# EAGLE design EiBotBoard-v27 (EAGLE 9.6.2)
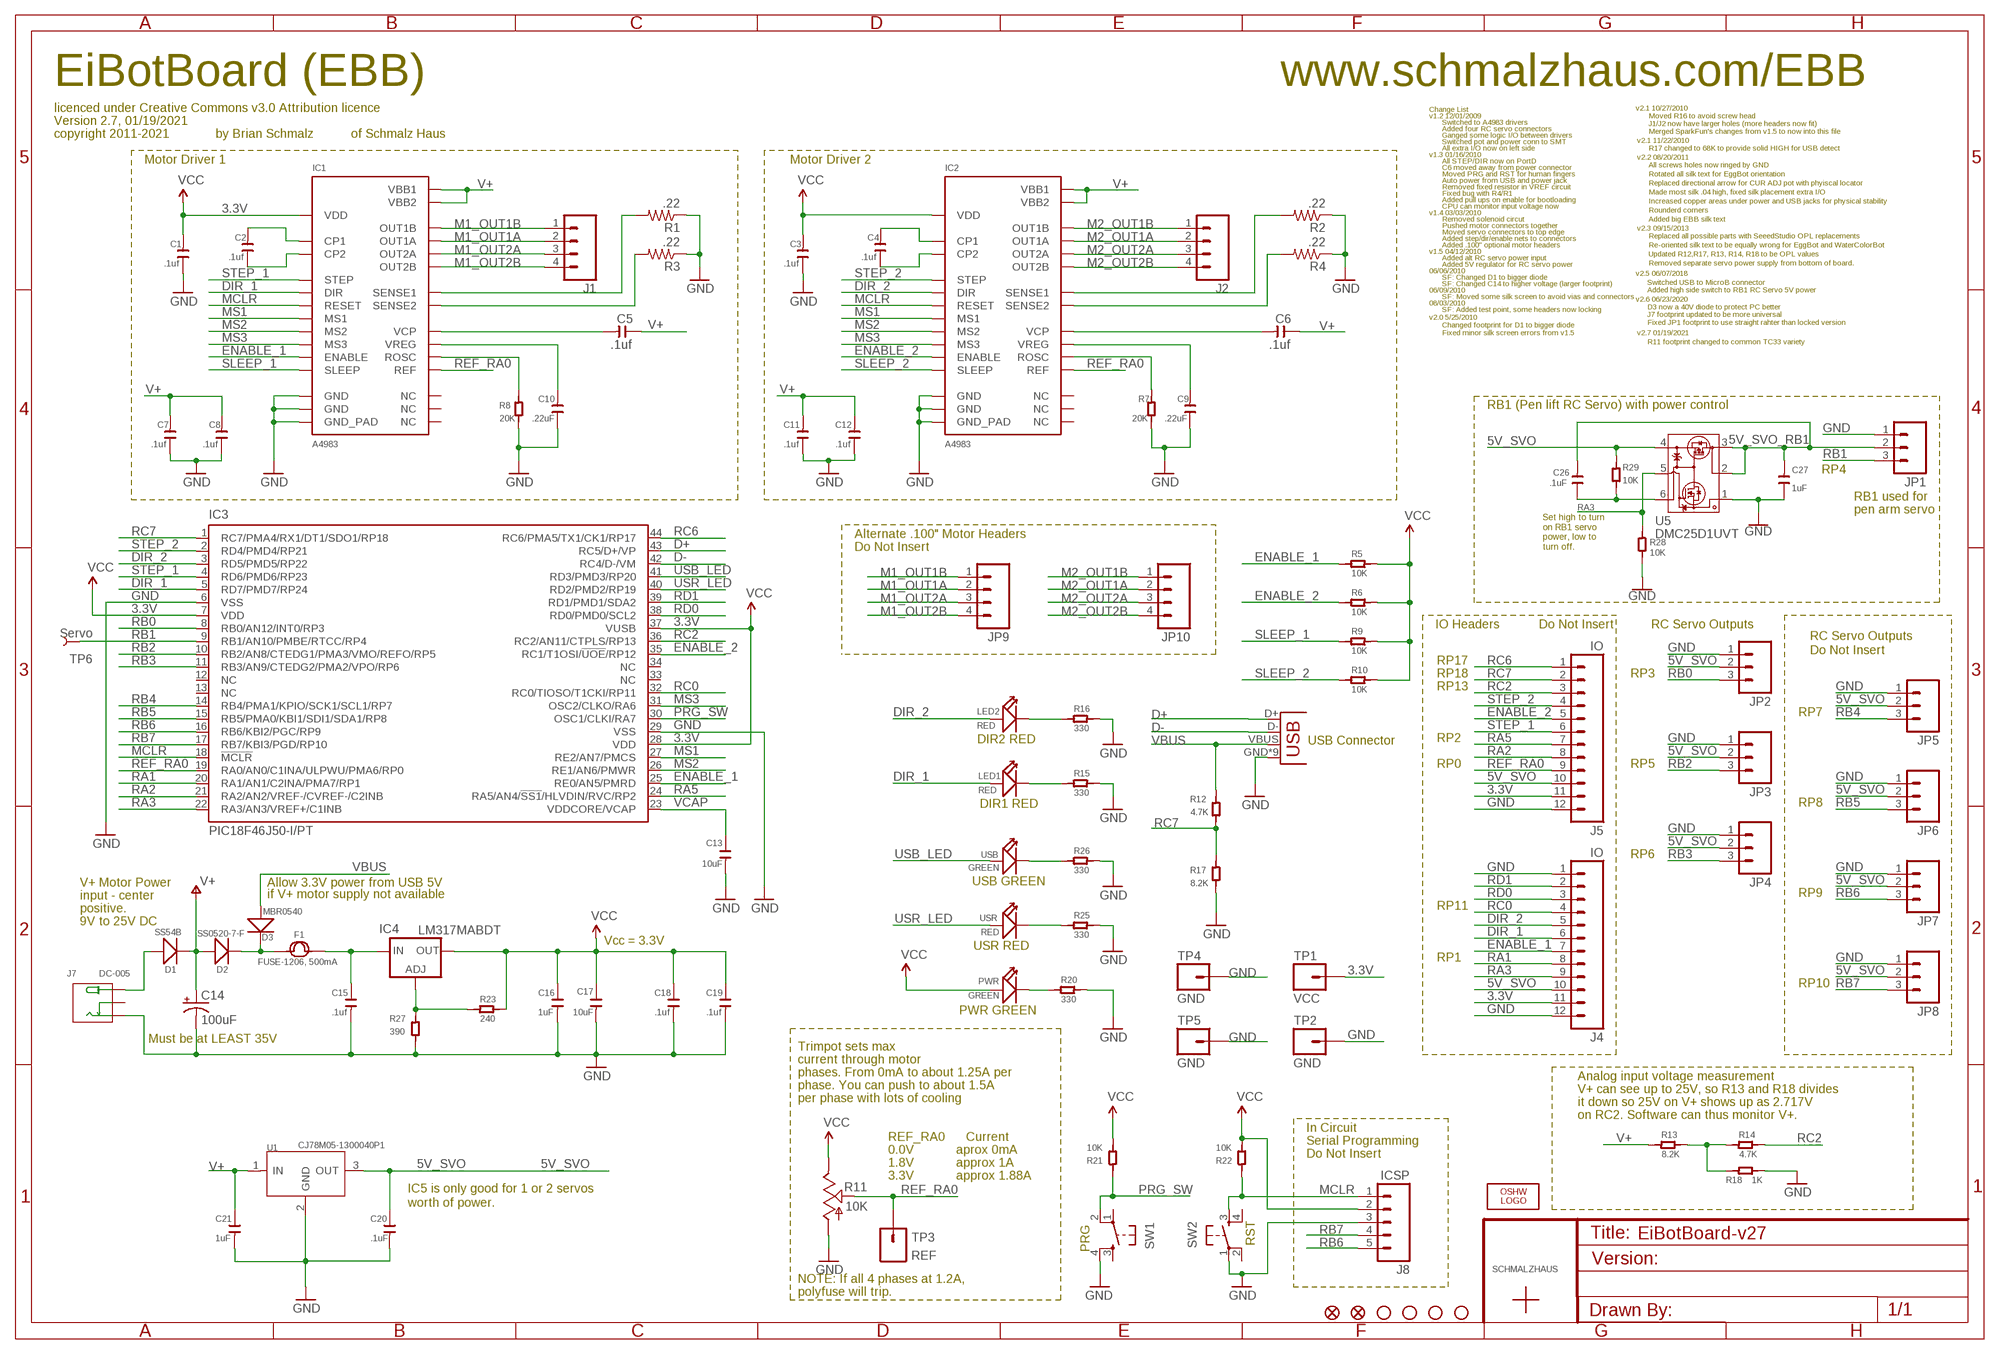
[diagram p0: schematic, sheet 1]

## Parts
C1  .1uf  C-0603  [C0603]
C2  .1uf  C-0603  [C0603]
C3  .1uf  C-0603  [C0603]
C4  .1uf  C-0603  [C0603]
C5  .1uf  C-0603  [C0603]
C6  .1uf  C-0603  [C0603]
C7  .1uf  C-0603  [C0603]
C8  .1uf  C-0603  [C0603]
C9  .22uF  C-0603  [C0603]
C10  .22uF  C-0603  [C0603]
C11  .1uf  C-0603  [C0603]
C12  .1uf  C-0603  [C0603]
C13  10uF  C-0805  [C0805]
C14  100uF  CAP_POLD  [PANASONIC_D]
C15  .1uf  C-0603  [C0603]
C16  1uF  C-0603  [C0603]
C17  10uF  C-0805  [C0805]
C18  .1uf  C-0603  [C0603]
C19  .1uf  C-0603  [C0603]
C20  .1uF  C-0603  [C0603]
C21  1uF  C-0603  [C0603]
C26  .1uF  C-0603  [C0603]
C27  1uF  C-0603  [C0603]
D1  SS54B  D-SMB  [SMB]
D2  SS0520-7-F  D-SOD-123  [SOD123]
D3  MBR0540  D-SOD-123  [SOD123]
F1  FUSE-1206, 500mA  FUSE-1206  [F1206]
IC1  A4983  [QFN28]
IC2  A4983  [QFN28]
IC3  PIC18F46J50-I/PT  PIC18F4J50  [TQFP44]
IC4  LM317MABDT  [DPACK]
J1  SCHMALZHAUS_M04  [SCHMALZHAUS_SCREWTERMINAL-3.5MM-4_LOCK]
J2  SCHMALZHAUS_M04  [SCHMALZHAUS_SCREWTERMINAL-3.5MM-4_LOCK]
J3  USBMICROB  [USB-MICROB_FCI_PINS]
J4  IO  M12PTH  [1X12]
J5  IO  M12PTH  [1X12]
J7  DC-005  CONN-POWER-JACK-2.1MM(DC-005)  [DCJ3P-14.2X11.0X9.0MM]
J8  ICSP  M05_WIDENOSILK  [1X05_NOSILK]
JP1  M031X03_NO_SILK  [1X03_NO_SILK]
JP2  M031X03_NO_SILK  [1X03_NO_SILK]
JP3  M031X03_NO_SILK  [1X03_NO_SILK]
JP4  M031X03_NO_SILK  [1X03_NO_SILK]
JP5  M031X03_NO_SILK  [1X03_NO_SILK]
JP6  M031X03_NO_SILK  [1X03_NO_SILK]
JP7  M031X03_NO_SILK  [1X03_NO_SILK]
JP8  M031X03_NO_SILK  [1X03_NO_SILK]
JP9  M04POLAR  [MOLEX-1X4]
JP10  M04POLAR  [MOLEX-1X4]
JP14  FIDUCIAL1X2  [FIDUCIAL-1X2]
JP15  FIDUCIAL1X2  [FIDUCIAL-1X2]
LED1  RED  LED  [LED0603]
LED2  RED  LED  [LED0603]
LOGO1  OSHW_LOGO_8MILX0100-NT  [OSHW_8X100_NOTEXT]
PWR  GREEN  LED  [LED0603]
R1  .22  R-US_R0805  [R0805]
R2  .22  R-US_R0805  [R0805]
R3  .22  R-US_R0805  [R0805]
R4  .22  R-US_R0805  [R0805]
R5  10K  R-0603  [R0603]
R6  10K  R-0603  [R0603]
R7  20K  R-0603  [R0603]
R8  20K  R-0603  [R0603]
R9  10K  R-0603  [R0603]
R10  10K  R-0603  [R0603]
R11  10K  POT3MM  [3MM_GENERIC_TRIMMER_POT]
R12  4.7K  R-0603  [R0603]
R13  8.2K  R-0603  [R0603]
R14  4.7K  R-0603  [R0603]
R15  330  R-0603  [R0603]
R16  330  R-0603  [R0603]
R17  8.2K  R-0603  [R0603]
R18  1K  R-0603  [R0603]
R20  330  R-0603  [R0603]
R21  10K  R-0603  [R0603]
R22  10K  R-0603  [R0603]
R23  240  R-0603  [R0603]
R25  330  R-0603  [R0603]
R26  330  R-0603  [R0603]
R27  390  R-0603  [R0603]
R28  10K  R-0603  [R0603]
R29  10K  R-0603  [R0603]
SW1  PRG  TAC_SWITCHSND  [TACTILE_SWITCH_SMD]
SW2  RST  TAC_SWITCHSND  [TACTILE_SWITCH_SMD]
TP1  VCC  M01_WIDENOSLIK  [1X01_NOSILK]
TP2  GND  M01_WIDENOSLIK  [1X01_NOSILK]
TP3  REF  M01PTH  [1X01]
TP4  GND  M01_WIDENOSLIK  [1X01_NOSILK]
TP5  GND  M01_WIDENOSLIK  [1X01_NOSILK]
TP6  Servo  TEST-POINT3X5  [PAD.03X.05]
U1  CJ78M05-1300040P1  [TO252]
U5  DMC25D1UVT  [TSOT26]
U$1  SCHMALZHAUSSCHMALZHAUS_SMALL  [SCHMALZHAUS_SMALL]
U$2  STAND-OFF  [STAND-OFF]
U$3  STAND-OFF  [STAND-OFF]
U$4  STAND-OFF  [STAND-OFF]
U$5  STAND-OFF  [STAND-OFF]
USB  GREEN  LED  [LED0603]
USR  RED  LED  [LED0603]

## Nets
3.3V: C1.1 C3.1 C16.2 C17.2 C18.2 C19.2 IC1.P$15(VDD) IC2.P$15(VDD) IC3.7(VDD) IC3.28(VDD) IC3.37(VUSB) IC4.4(OUT) J4.11 J5.11 J8.2 PWR.+ R5.1 R6.1 R9.1 R10.1 R11.1(E) R21.2 R22.2 R23.2 TP1.1 ; supply symbol labelled VCC
5V_SVO: C20.2 J4.10 J5.10 JP2.2 JP3.2 JP4.2 JP5.2 JP6.2 JP7.2 JP8.2 R29.1 U1.3(OUT) U5.4(VIN_R1)
5V_SVO_RB1: C26.1 C27.1 JP1.2 U5.2(VOUT_C1$2) U5.3(VOUT_C1$1)
D+: IC3.43(RC5/D+/VP) J3.D+
D-: IC3.42(RC4/D-/VM) J3.D-
DIR_1: IC1.P$19(DIR) IC3.5(RD7/PMD7/RP24) J4.6 LED1.+
DIR_2: IC2.P$19(DIR) IC3.3(RD5/PMD5/RP22) J4.5 LED2.+
ENABLE_1: IC1.P$2(ENABLE) IC3.25(RE0/AN5/PMRD) J4.7 R5.2
ENABLE_2: IC2.P$2(ENABLE) IC3.35(RC1/T1OSI/!UOE!/RP12) J5.5 R6.2
GND: C1.2 C3.2 C7.2 C8.2 C9.2 C10.2 C11.2 C12.2 C13.1 C14.- C15.1 C16.1 C17.1 C18.1 C19.1 C20.1 C21.1 C27.2 IC1.P$3(GND) IC1.P$18(GND) IC1.P$29(GND_PAD) IC2.P$3(GND) IC2.P$18(GND) IC2.P$29(GND_PAD) IC3.6(VSS) IC3.29(VSS) J3.GND J3.GND@1(GND) J3.GND@2(GND) J3.GND@3(GND) J3.GND@4(GND) J3.GND@5(GND) J3.GND@6(GND) J3.GND@7(GND) J3.GND@8(GND) J4.1 J4.12 J5.12 J7.P$2(-) J8.3 JP1.1 JP2.1 JP3.1 JP4.1 JP5.1 JP6.1 JP7.1 JP8.1 R1.1 R2.1 R3.1 R4.1 R7.2 R8.2 R11.3(A) R15.1 R16.1 R17.2 R18.2 R20.1 R25.1 R26.1 R27.2 R28.2 SW1.4 SW2.1 TP2.1 TP4.1 TP5.1 U1.2(GND) U5.1(R2)
M1_OUT1A: IC1.P$24(OUT1A) J1.2 JP9.2
M1_OUT1B: IC1.P$21(OUT1B) J1.1 JP9.1
M1_OUT2A: IC1.P$26(OUT2A) J1.3 JP9.3
M1_OUT2B: IC1.P$1(OUT2B) J1.4 JP9.4
M2_OUT1A: IC2.P$24(OUT1A) J2.2 JP10.2
M2_OUT1B: IC2.P$21(OUT1B) J2.1 JP10.1
M2_OUT2A: IC2.P$26(OUT2A) J2.3 JP10.3
M2_OUT2B: IC2.P$1(OUT2B) J2.4 JP10.4
MCLR: IC1.P$12(RESET) IC2.P$12(RESET) IC3.18(!MCLR!) J8.1 R22.1 SW2.3
MS1: IC1.P$9(MS1) IC2.P$9(MS1) IC3.27(RE2/AN7/PMCS)
MS2: IC1.P$10(MS2) IC2.P$10(MS2) IC3.26(RE1/AN6/PMWR)
MS3: IC1.P$11(MS3) IC2.P$11(MS3) IC3.31(OSC2/CLKO/RA6)
N$1: LED2.- R16.2
N$2: D2.- D3.- F1.1
N$3: C2.1 IC1.P$4(CP1)
N$4: R13.2 R14.1 R18.1
N$5: C2.2 IC1.P$5(CP2)
N$6: D1.+ J7.P$1(+)
N$7: LED1.- R15.2
N$8: R26.2 USB.-
N$9: IC4.1(ADJ) R23.1 R27.1
N$10: R25.2 USR.-
N$11: PWR.- R20.2
N$16: C4.1 IC2.P$4(CP1)
N$17: C4.2 IC2.P$5(CP2)
N$19: IC1.P$13(ROSC) R8.1
N$20: C10.1 IC1.P$8(VREG)
N$21: C5.1 IC1.P$6(VCP)
N$31: IC1.P$27(SENSE2) R3.2
N$32: IC1.P$23(SENSE1) R1.2
N$36: C15.2 F1.2 IC4.3(IN)
N$41: C6.1 IC2.P$6(VCP)
N$43: IC2.P$23(SENSE1) R2.2
N$44: IC2.P$27(SENSE2) R4.2
N$45: C9.1 IC2.P$8(VREG)
N$48: IC2.P$13(ROSC) R7.1
N$1234: C26.2 R29.2 U5.6(R1_C1)
PRG_SW: IC3.30(OSC1/CLKI/RA7) R21.1 SW1.2
RA1: IC3.20(RA1/AN1/C2INA/PMA7/RP1) J4.8
RA2: IC3.21(RA2/AN2/VREF-/CVREF-/C2INB) J5.8
RA3: IC3.22(RA3/AN3/VREF+/C1INB) J4.9 R28.1 U5.5(ON/OFF)
RA5: IC3.24(RA5/AN4/!SS1!/HLVDIN/RVC/RP2) J5.7
RB0: IC3.8(RB0/AN12/INT0/RP3) JP2.3
RB1: IC3.9(RB1/AN10/PMBE/RTCC/RP4) JP1.3 TP6.P$1
RB2: IC3.10(RB2/AN8/CTEDG1/PMA3/VMO/REFO/RP5) JP3.3
RB3: IC3.11(RB3/AN9/CTEDG2/PMA2/VPO/RP6) JP4.3
RB4: IC3.14(RB4/PMA1/KPIO/SCK1/SCL1/RP7) JP5.3
RB5: IC3.15(RB5/PMA0/KBI1/SDI1/SDA1/RP8) JP6.3
RB6: IC3.16(RB6/KBI2/PGC/RP9) J8.5 JP7.3
RB7: IC3.17(RB7/KBI3/PGD/RP10) J8.4 JP8.3
RC0: IC3.32(RC0/TIOSO/T1CKI/RP11) J4.4
RC2: IC3.36(RC2/AN11/CTPLS/RP13) J5.3 R14.2
RC6: IC3.44(RC6/PMA5/TX1/CK1/RP17) J5.1
RC7: IC3.1(RC7/PMA4/RX1/DT1/SDO1/RP18) J5.2 R12.2 R17.1
RD0: IC3.38(RD0/PMD0/SCL2) J4.3
RD1: IC3.39(RD1/PMD1/SDA2) J4.2
REF_RA0: IC1.P$17(REF) IC2.P$17(REF) IC3.19(RA0/AN0/C1INA/ULPWU/PMA6/RP0) J5.9 R11.2(S) TP3.1
SLEEP_1: IC1.P$14(SLEEP) R9.2
SLEEP_2: IC2.P$14(SLEEP) R10.2
STEP_1: IC1.P$16(STEP) IC3.4(RD6/PMD6/RP23) J5.6
STEP_2: IC2.P$16(STEP) IC3.2(RD4/PMD4/RP21) J5.4
USB_LED: IC3.41(RD3/PMD3/RP20) USB.+
USR_LED: IC3.40(RD2/PMD2/RP19) USR.+
V+: C5.2 C6.2 C7.1 C8.1 C11.1 C12.1 C14.+ C21.2 D1.- D2.+ IC1.P$22(VBB1) IC1.P$28(VBB2) IC2.P$22(VBB1) IC2.P$28(VBB2) R13.1 U1.1(IN)
VBUS: D3.+ J3.VBUS R12.1
VCAP: C13.2 IC3.23(VDDCORE/VCAP)
Unconnected: IC1.P$7(NC) IC1.P$20(NC) IC1.P$25(NC) IC2.P$7(NC) IC2.P$20(NC) IC2.P$25(NC) IC3.12(NC) IC3.13(NC) IC3.33(NC) IC3.34(NC) J7.P$3(CDN) SW1.1 SW1.3 SW2.2 SW2.4

## Notes on the sheet
- EiBotBoard (EBB) | www.schmalzhaus.com/EBB
- licenced under Creative Commons v3.0 Attribution licence | Change List | v2.1 10/27/2010
- v1.2 12/01/2009 | Moved R16 to avoid screw head
- Version 2.7, 01/19/2021 | Switched to A4983 drivers | J1/J2 now have larger holes (more headers now fit)
- Added four RC servo connectors
- Merged SparkFun's changes from v1.5 to now into this file
- copyright 2011-2021 | by Brian Schmalz | of Schmalz Haus | Ganged some logic I/O between drivers
- Switched pot and power conn to SMT | v2.1 11/22/2010
- All extra I/O now on left side | R17 changed to 68K to provide solid HIGH for USB detect
- v1.3 01/16/2010
- v2.2 08/20/2011
- Motor Driver 1 | Motor Driver 2 | All STEP/DIR now on PortD
- All screws holes now ringed by GND
- C6 moved away from power connector
- Moved PRG and RST for human fingers | Rotated all silk text for EggBot orientation
- Auto power from USB and power jack
- Replaced directional arrow for CUR ADJ pot with phyiscal locator
- Removed fixed resistor in VREF circuit
- Fixed bug with R4/R1 | Made most silk .04 high, fixed silk placement extra I/O
- Added pull ups on enable for bootloading | Increased copper areas under power and USB jacks for physical stability
- CPU can monitor input voltage now
- Rounderd corners
- v1.4 03/03/2010
- Removed solenoid circut | Added big EBB silk text
- Pushed motor connectors together
- v2.3 09/15/2013
- Moved servo connectors to top edge
- Replaced all possible parts with SeeedStudio OPL replacements
- Added step/dir/enable nets to connectors
- Added .100" optional motor headers | Re-oriented silk text to be equally wrong for EggBot and WaterColorBot
- v1.5 04/12/2010
- Updated R12,R17, R13, R14, R18 to be OPL values
- Added alt RC servo power input
- Added 5V regulator for RC servo power | Removed separate servo power supply from bottom of board.
- 06/06/2010
- v2.5 06/07/2018
- SF: Changed D1 to bigger diode
- SF: Changed C14 to higher voltage (larger footprint)
- 06/09/2010
- Switched USB to MicroB connector
  Added high side switch to RB1 RC Servo 5V power
- SF: Moved some silk screen to avoid vias and connectors
- v2.6 06/23/2020
- 08/03/2010
- SF: Added test point, some headers now locking
- v2.0 5/25/2010
- D3 now a 40V diode to protect PC better
  J7 footprint updated to be more universal
  Fixed JP1 footprint to use straight rahter than locked version
- Changed footprint for D1 to bigger diode
- Fixed minor silk screen errors from v1.5 | v2.7 01/19/2021
- R11 footprint changed to common TC33 variety
- RB1 (Pen lift RC Servo) with power control
- RP4
- RB1 used for
- pen arm servo
- Alternate .100" Motor Headers
- Set high to turn 
  on RB1 servo 
  power, low to 
  turn off.
- Do Not Insert
- IO Headers | Do Not Insert | RC Servo Outputs
- RC Servo Outputs
- Do Not Insert
- RP17
- RP18 | RP3
- RP13
- RP7
- DIR2 RED | USB Connector | RP2
- RP0 | RP5
- DIR1 RED | RP8
- RP6
- V+ Motor Power | Allow 3.3V power from USB 5V | USB GREEN
- input - center | if V+ motor supply not available | RP9
- positive. | RP11
- 9V to 25V DC
- Vcc = 3.3V
- USR RED
- RP1
- RP10
- PWR GREEN
- Must be at LEAST 35V
- Trimpot sets max
- current through motor
- phases. From 0mA to about 1.25A per
- Analog input voltage measurement
- phase. You can push to about 1.5A
- V+ can see up to 25V, so R13 and R18 divides
- per phase with lots of cooling
- it down so 25V on V+ shows up as 2.717V
- on RC2. Software can thus monitor V+.
- In Circuit
- REF_RA0      Current
- Serial Programming
- 0.0V            aprox 0mA
- Do Not Insert
- 1.8V            approx 1A
- 3.3V            approx 1.88A
- IC5 is only good for 1 or 2 servos
- worth of power.
- PRG
- RST
- NOTE: If all 4 phases at 1.2A,
- polyfuse will trip.

## Library data of the parts
C1-C13 C15-C21 C26 C27 = OPL Eagle Library:C*
C14 = SparkFun:CAP_POL: Capacitor Polarized These are standard SMD and PTH capacitors. Normally 10uF, 47uF, and 100uF in electrolytic and tantalum varieties. Always verify the external diameter of the through hole cap, it varies with capacity, voltage, and manufacturer. The EIA devices should be standard.
D1-D3 = OPL Eagle Library:D*: DIODE
F1 = OPL Eagle Library:FUSE*
IC1 IC2 = SchmalzHaus:A4983
IC3 = SchmalzHaus:PIC18F4*J50
IC4 = v-reg:LM317?*: 500 mA Adjustable Output Positive Voltage Regulator Source: http://www.onsemi.co.jp .. LM317M-D.PDF
J1 J2 = EiBotBoard-v21:SCHMALZHAUS_M04: Header 4 Standard 4-pin 0.1" header. Use with straight break away headers (SKU : PRT-00116), right angle break away headers (PRT-00553), swiss pins (PRT-00743), machine pins (PRT-00117), and female headers (PRT-00115). Molex polarized connector foot print use with SKU : PRT-08231 with associated crimp pins and housings.
J3 = SchmalzHaus:USB: USB Connectors USB-B-PTH is fully proven SKU : PRT-00139 USB-miniB is fully proven SKU : PRT-00587 USB-A-PCB is untested. USB-A-H is throughly reviewed, but untested. Spark Fun Electronics SKU : PRT-00437 USB-B-SMT is throughly reviewed, but untested. Needs silkscreen touching up. USB-A-S has not been used/tested USB-MB-H has not been used/tested
J4 J5 = SparkFun-12-01-09:M12: Header 12 Standard 12-pin 0.1" header. Use with straight break away headers (SKU : PRT-00116), right angle break away headers (PRT-00553), swiss pins (PRT-00743), machine pins (PRT-00117), and female headers (PRT-00115).
J7 = OPL_Connector_SH:CONN-POWER-JACK-2.1MM(DC-005): Seeed SKU 320120003 - DIP Black DC Jack 2.1MM MPN: DC-005 Important Notes: This part requires milling slots. Please make sure layer 46 Milling is included in the profile or outline layer when exporting Gerber files. Alternatively, you can use the built-in Seeed Fusion CAM file. Find it under Third-Party CAM files. Seeed Fusion PCBA OPL <https://www.seeedstudio.com/opl.html> Order PCB/PCBA Now <https://www.seeedstudio.com/fusion_pcb.html> www.seeedstudio.com; MPN: DC-005
J8 = SchmalzHaus:M05_WIDE: Header 5 Standard 5-pin 0.1" header. Use with straight break away headers (SKU : PRT-00116), right angle break away headers (PRT-00553), swiss pins (PRT-00743), machine pins (PRT-00117), and female headers (PRT-00115). Molex polarized connector foot print use with SKU : PRT-08230 with associated crimp pins and housings.
JP1 = SparkFun:M03: Header 3 Standard 3-pin 0.1" header. Use with straight break away headers (SKU : PRT-00116), right angle break away headers (PRT-00553), swiss pins (PRT-00743), machine pins (PRT-00117), and female headers (PRT-00115). Molex polarized connector foot print use with SKU : PRT-08232 with associated crimp pins and housings.
JP2-JP8 = SparkFun-12-01-09:M03: Header 3 Standard 3-pin 0.1" header. Use with straight break away headers (SKU : PRT-00116), right angle break away headers (PRT-00553), swiss pins (PRT-00743), machine pins (PRT-00117), and female headers (PRT-00115). Molex polarized connector foot print use with SKU : PRT-08232 with associated crimp pins and housings.
JP9 JP10 = SparkFun-12-01-09:M04: Header 4 Standard 4-pin 0.1" header. Use with straight break away headers (SKU : PRT-00116), right angle break away headers (PRT-00553), swiss pins (PRT-00743), machine pins (PRT-00117), and female headers (PRT-00115). Molex polarized connector foot print use with SKU : PRT-08231 with associated crimp pins and housings.
JP14 JP15 = SparkFun:FIDUCIAL: Fiducial Alignment Points Various fiducial points for machine vision alignment.
LED1 LED2 PWR USB USR = OPL Eagle Library:LED*: LED
LOGO1 = OSHW:OSHW_LOGO_8MIL
R1-R4 = rcl:R-US_: RESISTOR, American symbol; SPICEPREFIX: R
R5-R10 R12-R18 R20-R23 R25-R29 = OPL Eagle Library:R*
R11 = SchmalzHaus:POT
SW1 SW2 = SparkFunEagle-6-6-07:TAC_SWITCH: Momentary Switch Button commonly used for reset or general input. Spark Fun Electronics SKU : COM-00097
TP1 TP2 TP4 TP5 = SchmalzHaus:M01_WIDE: Header 1 Standard 1-pin 0.1" header. Use with straight break away headers (SKU : PRT-00116), right angle break away headers (PRT-00553), swiss pins (PRT-00743), machine pins (PRT-00117), and female headers (PRT-00115).
TP3 = SchmalzHaus:M01: Header 1 Standard 1-pin 0.1" header. Use with straight break away headers (SKU : PRT-00116), right angle break away headers (PRT-00553), swiss pins (PRT-00743), machine pins (PRT-00117), and female headers (PRT-00115).
TP6 = SparkFun:TEST-POINT
U1 = OPL Eagle Library:CJ78M05: 0.5A Three Terminal Positive Voltage Regulators
U5 = DiodesInc_DMC25D1UVT:DMC25D1UVT: Diodes Incorporated DMC25D1UVT.
U$1 = SchmalzHaus:SCHMALZHAUS
U$2-U$5 = SparkFun01082009:STAND-OFF: Stand Off This is the mechanical footprint for a #4 phillips button head screw. Use the keepout ring to avoid running the screw head into surrounding components. SKU : PRT-00447

## Board
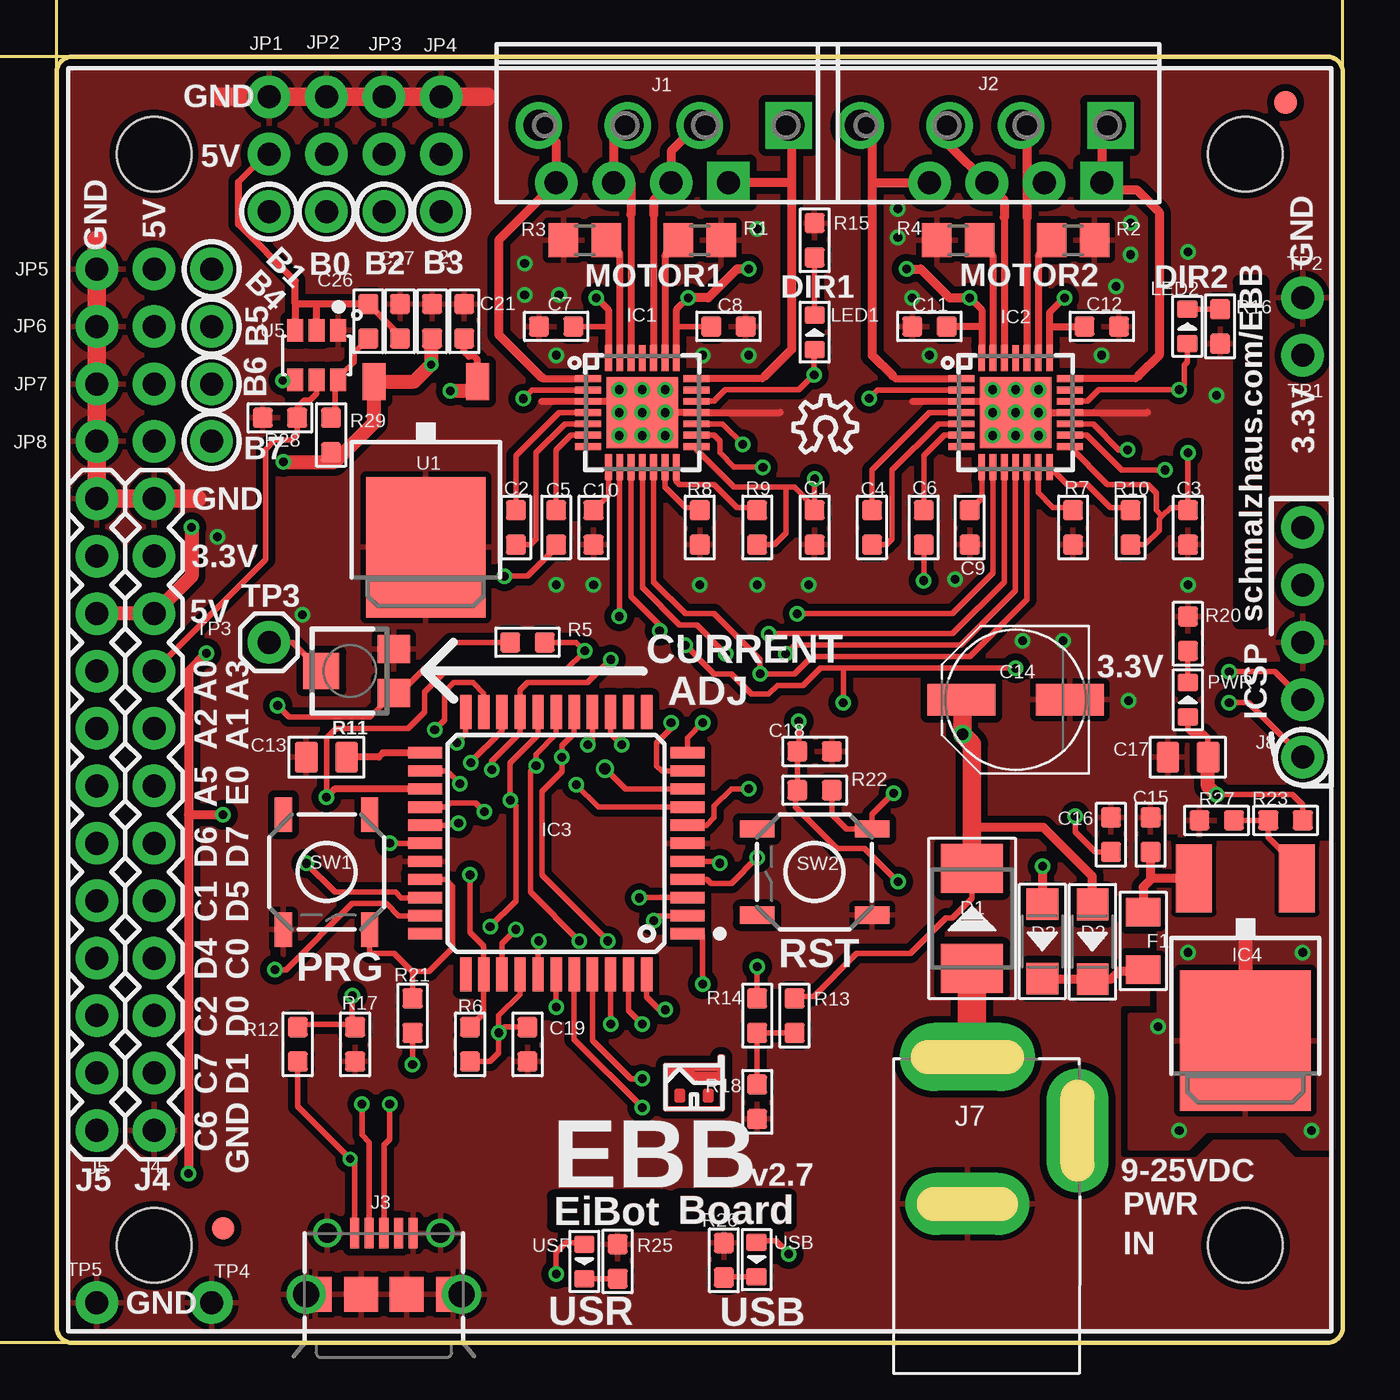
[diagram p1: board, top side]
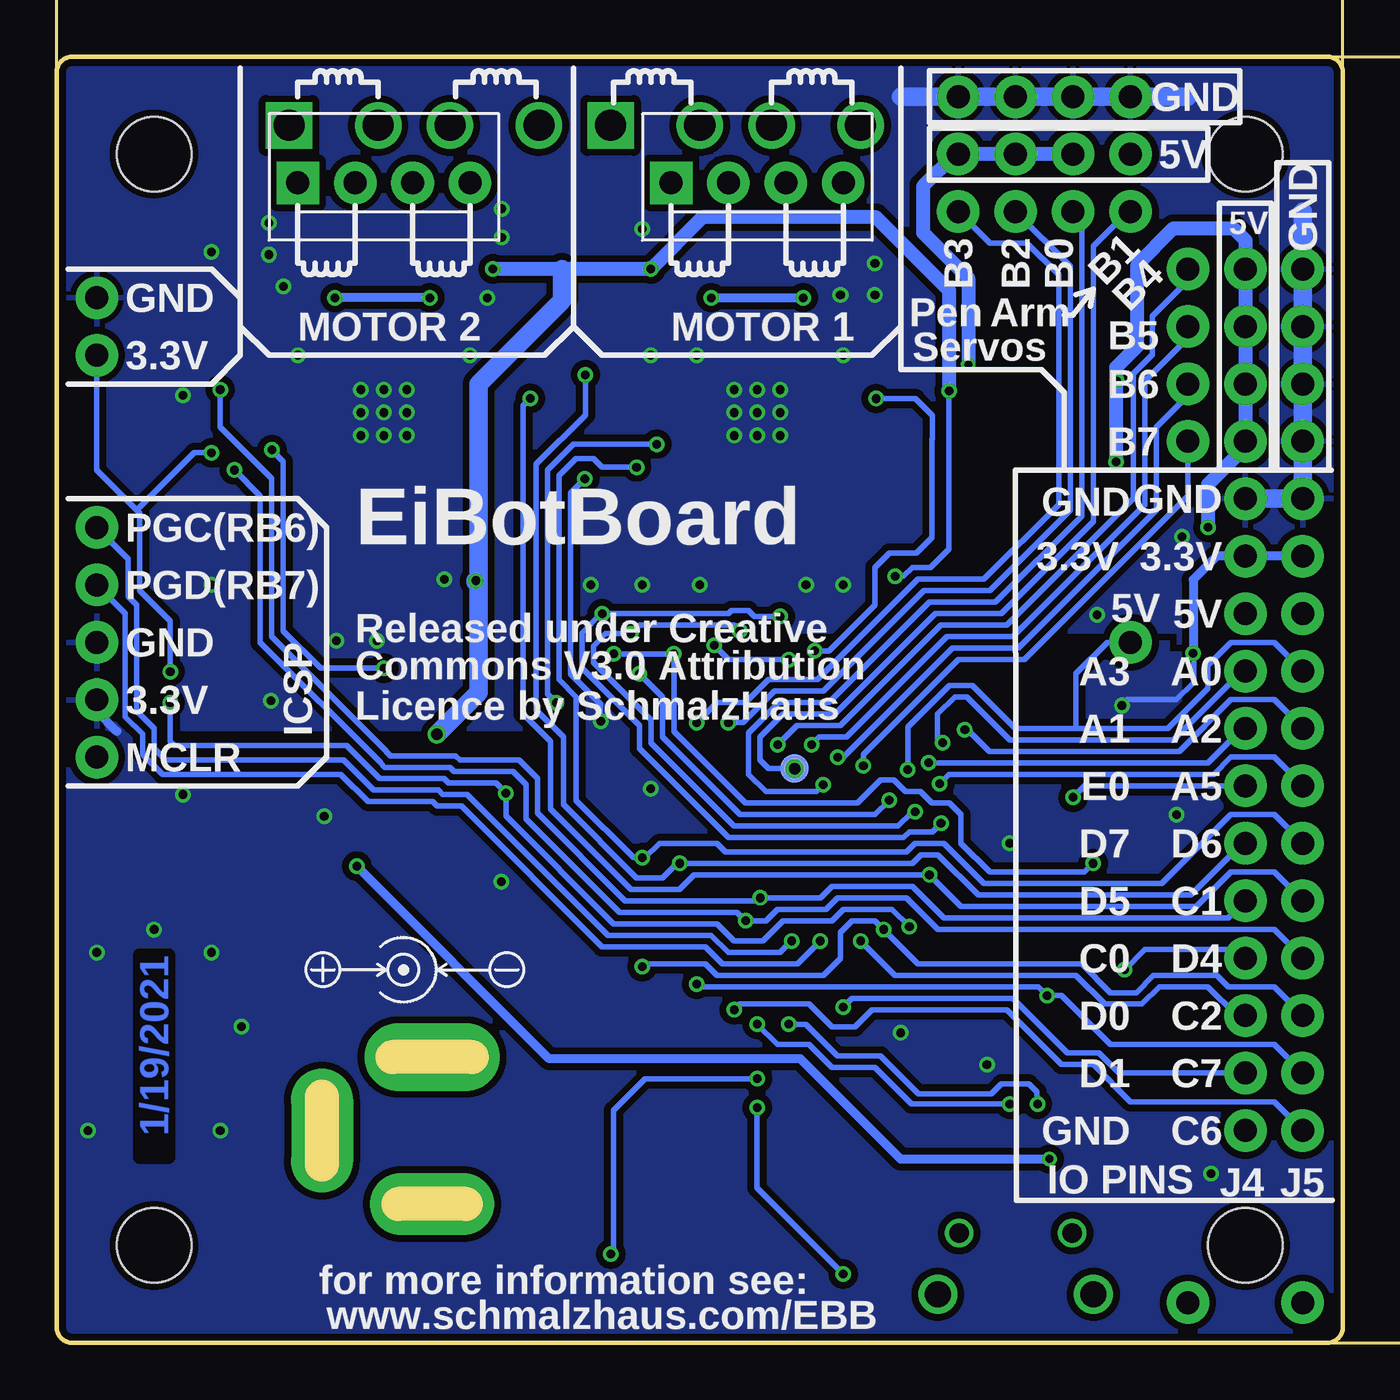
[diagram p2: board, bottom side, seen from below]

Size 56.9 x 56.9 mm. Coordinates in mm from the lower left corner, seen from the top.
Outline: 56.18,0 arc90 56.9,0.72 56.9,56.18 arc90 56.18,56.9 0.72,56.9 arc90 0,56.18 0,0.72 arc90 0.72,0 56.18,0
Copper layers (1*16): Top 0.035mm / dielectric 0.2mm / Bottom 0.035mm
Design rules "SeeedStudio_DRU_20130527 *": minimum track width 6mil, minimum drill 12mil, track to track 8mil, track to pad 8mil, pad to pad 8mil, via to via 8mil, smd to smd 0mil, copper to edge 10mil, drill to drill 10mil, minimum pad ring 6mil, minimum via ring 6mil, stop-mask expansion 2mil, vias tented up to drill 25mil, thermal gap 10mil
Milling: area -13.8,55.4 to -13.2,56.9; area -13.8,0 to -13.2,1.5; area -13.1,22.9 to -11.3,34; area 0,70.1 to 1.5,70.7; area 55.4,70.1 to 56.9,70.7; area 22.9,70.8 to 34,72.5; 6 lines

### Footprints (pad centres in the part's own frame; a part is rotated, then mirrored left to right if it is on the bottom)
C0603 = smd 0.889 x 0.889: 1 -0.762,0; 2 0.762,0
C0805 = smd 1.016 x 1.397: 1 -0.889,0; 2 0.889,0
PANASONIC_D = smd 3 x 1.4: + 2.4,0; - -2.4,0
SMB = smd 2.159 x 2.743: + -2.21,0; - 2.21,0
SOD123 = smd 1.397 x 1.397: + -1.651,0; - 1.651,0
F1206 = smd 1.27 x 1.524: 1 -1.27,0; 2 1.27,0
QFN28 = smd 1.15 x 0.3: P$1 -2.4,1.5; P$2 -2.4,1; P$3 -2.4,0.5; P$4 -2.4,0; P$5 -2.4,-0.5; P$6 -2.4,-1; P$7 -2.4,-1.5; P$15 2.4,-1.5; P$16 2.4,-1; P$17 2.4,-0.5; P$18 2.4,0; P$19 2.4,0.5; P$20 2.4,1; P$21 2.4,1.5 | smd 0.3 x 1.15: P$8 -1.5,-2.4; P$9 -1,-2.4; P$10 -0.5,-2.4; P$11 0,-2.4; P$12 0.5,-2.4; P$13 1,-2.4; P$14 1.5,-2.4; P$22 1.5,2.4; P$23 1,2.4; P$24 0.5,2.4; P$25 0,2.4; P$26 -0.5,2.4; P$27 -1,2.4; P$28 -1.5,2.4 | smd 3.15 x 3.15: P$29 0,0
TQFP44 = smd 1.5 x 0.5: 1 -5.8,4; 2 -5.8,3.2; 3 -5.8,2.4; 4 -5.8,1.6; 5 -5.8,0.8; 6 -5.8,0; 7 -5.8,-0.8; 8 -5.8,-1.6; 9 -5.8,-2.4; 10 -5.8,-3.2; 11 -5.8,-4; 23 5.8,-4; 24 5.8,-3.2; 25 5.8,-2.4; 26 5.8,-1.6; 27 5.8,-0.8; 28 5.8,0; 29 5.8,0.8; 30 5.8,1.6; 31 5.8,2.4; 32 5.8,3.2; 33 5.8,4 | smd 0.5 x 1.5: 12 -4,-5.8; 13 -3.2,-5.8; 14 -2.4,-5.8; 15 -1.6,-5.8; 16 -0.8,-5.8; 17 0,-5.8; 18 0.8,-5.8; 19 1.6,-5.8; 20 2.4,-5.8; 21 3.2,-5.8; 22 4,-5.8; 34 4,5.8; 35 3.2,5.8; 36 2.4,5.8; 37 1.6,5.8; 38 0.8,5.8; 39 0,5.8; 40 -0.8,5.8; 41 -1.6,5.8; 42 -2.4,5.8; 43 -3.2,5.8; 44 -4,5.8
DPACK = smd 1.6 x 3: 1 -2.28,-4.8; 3 2.28,-4.8 | smd 5.8 x 6.2: 4 0,2.38
SCHMALZHAUS_SCREWTERMINAL-3.5MM-4_LOCK = drill 1.372 square: 1 -0.127,0 | drill 1.372: 2 3.81,0; 3 6.985,0; 4 10.922,0
USB-MICROB_FCI_PINS = smd 0.4 x 1.35: D+ 0,2.7; D- -0.65,2.7; GND 1.3,2.7; ID 0.65,2.7; VBUS -1.3,2.7 | drill 1.15: GND@1 -3.445,0; GND@2 3.445,0 | drill 0.85: GND@3 -2.5,2.7; GND@4 2.5,2.7 | smd 1.5 x 1.55: GND@5 -3.05,0; GND@6 -1,0; GND@7 1,0; GND@8 3.05,0
1X12 = drill 1.016 pad 1.88: 1 0,0; 2 2.54,0; 3 5.08,0; 4 7.62,0; 5 10.16,0; 6 12.7,0; 7 15.24,0; 8 17.78,0; 9 20.32,0; 10 22.86,0; 11 25.4,0; 12 27.94,0
DCJ3P-14.2X11.0X9.0MM = drill 0.6 pad 3 long: P$1 3.25,0 | drill 0.6 pad 2.75 long: P$2 -3.25,0; P$3 0,-4.877
1X05_NOSILK = drill 1.016 pad 1.88: 1 0,0; 2 2.54,0; 3 5.08,0; 4 7.62,0; 5 10.16,0
1X03_NO_SILK = drill 1.016 pad 1.88: 1 0,0; 2 2.54,0; 3 5.08,0
MOLEX-1X4 = drill 1.016 pad 1.88 square: 1 0,0 | drill 1.016 pad 1.88: 2 2.54,0; 3 5.08,0; 4 7.62,0
FIDUCIAL-1X2 = smd 1 x 1: 1 0,0
LED0603 = smd 0.762 x 0.889: + -0.762,0; - 0.762,0
R0805 = smd 1.3 x 1.5: 1 -0.95,0; 2 0.95,0
R0603 = smd 0.889 x 0.889: 1 -0.762,0; 2 0.762,0
3MM_GENERIC_TRIMMER_POT = smd 1.42 x 1.25: 1 1.71,-0.975; 3 1.71,0.975 | smd 1.6 x 1.6: 2 -1.5,0
TACTILE_SWITCH_SMD = smd 1.524 x 0.762: 1 -2.54,1.905; 2 2.54,1.905; 3 -2.54,-1.905; 4 2.54,-1.905
1X01_NOSILK = drill 1.016 pad 1.88: 1 0,0
1X01 = drill 1.016 pad 1.88: 1 0,0
PAD.03X.05 = smd 1.27 x 1.27: P$1 0,0
TO252 = smd 1.016 x 1.651: 1 -2.286,-4.826; 3 2.286,-4.826 | smd 5.3 x 6.2: 2 0,2.5
TSOT26 = smd 0.7 x 1: 1 -0.95,-1.099; 2 0,-1.099; 3 0.95,-1.099; 4 0.95,1.099; 5 0,1.099; 6 -0.95,1.099
STAND-OFF = hole 3.302: 0,0

### Placement (x,y rotation side)
C1  33.53,36.07 270 top
C2  20.32,36.07 270 top
C3  50.04,36.07 270 top
C4  36.07,36.07 270 top
C5  22.1,36.07 270 top
C6  38.35,36.07 270 top
C7  22.1,44.96 180 top
C8  29.72,44.96 0 top
C9  40.39,36.07 270 top
C10  23.75,36.07 270 top
C11  38.61,44.96 180 top
C12  46.23,44.96 0 top
C13  11.94,25.91 0 top
C14  42.42,28.45 180 top
C15  48.39,22.48 270 top
C16  46.63,22.48 270 top
C17  50.04,25.91 0 top
C18  33.53,26.16 180 top
C19  20.83,13.21 90 top
C20  16.61,45.19 270 top
C21  18.03,45.19 270 top
C26  13.79,45.19 270 top
C27  15.19,45.19 90 top
D1  40.49,18.78 90 top
D2  45.82,17.75 270 top
D3  43.6,17.76 270 top
DRILEGEND  [DRILEGEND]  79.92,54.46 0 top  (outside the outline)
F1  48.06,17.78 90 top
IC1  25.91,41.15 0 top
IC2  42.42,41.15 0 top
IC3  22.1,22.1 180 top
IC4  52.58,15.75 180 top
J1  32.26,53.85 180 top
J2  46.48,53.85 180 top
J3  14.48,2.16 0 top
J4  4.32,9.4 90 top
J5  1.78,9.4 90 top
J7  40.28,9.4 90 top
J8  55.12,25.91 90 top
JP1  9.4,55.12 270 top
JP2  11.94,55.12 270 top
JP3  14.48,55.12 270 top
JP4  17.02,55.12 270 top
JP5  1.78,47.5 0 top
JP6  1.78,44.96 0 top
JP7  1.78,42.42 0 top
JP8  1.78,39.88 0 top
JP9  29.72,51.31 0 bottom
JP10  46.23,51.31 0 bottom
JP14  54.36,54.86 0 top
JP15  7.37,5.08 0 top
LED1  33.53,44.7 90 top
LED2  50.01,44.96 90 top
LOGO1  32.59,39.37 0 top
PWR  50.04,28.45 90 top
R1  28.45,48.77 180 top
R2  44.96,48.77 180 top
R3  23.37,48.77 0 top
R4  39.88,48.77 0 top
R5  20.83,30.99 0 top
R6  18.29,13.21 90 top
R7  44.96,36.07 270 top
R8  28.45,36.07 270 top
R9  30.99,36.07 90 top
R10  47.5,36.07 90 top
R11  13.21,29.72 0 top
R12  10.67,13.21 90 top
R13  32.64,14.48 270 top
R14  30.99,14.48 90 top
R15  33.53,48.77 270 top
R16  51.46,44.96 90 top
R17  13.21,13.21 270 top
R18  30.99,10.67 270 top
R20  50.04,31.37 270 top
R21  15.75,14.48 270 top
R22  33.53,24.45 180 top
R23  54.36,23.11 0 top
R25  24.82,3.61 270 top
R26  29.51,3.66 270 top
R27  51.31,23.11 180 top
R28  9.88,40.92 180 top
R29  12.14,40.16 90 top
SW1  11.94,20.83 270 top
SW2  33.53,20.83 180 top
TP1  55.12,43.69 0 top
TP2  55.12,46.23 0 top
TP3  9.4,30.99 0 top
TP4  6.86,1.78 0 top
TP5  1.78,1.78 0 top
TP6  24.26,25.4 0 bottom
U1  16.33,37.69 180 top
U5  11.51,43.69 180 top
U$1  28.19,10.36 0 top
U$2  52.58,4.32 0 top
U$3  4.32,4.32 0 top
U$4  52.58,52.58 0 top
U$5  4.32,52.58 0 top
USB  30.96,3.68 270 top
USR  23.34,3.61 270 top

### Tracks (layer width: path | path; a pad name or v marks a point on that pad's centre or on a via)
3.3V  (via drill 0.38)
  Top 0.254: IC1.P$15 28.31,39.51 29.97,37.85 32.26,37.85 | 32.26,37.85 32.64,37.85 33.53,36.96 C1.1 v33.53,38.23 | IC3.37 20.5,15.42 19.56,14.48 v19.56,13.72 | 48.9,36.58 48.77,36.45 48.77,35.94 48.13,35.31 R10.1 | 48.9,36.58 49.28,36.96 50,36.96 50,36.87 C3.1 v50.04,39.37 | 32.26,37.85 32.26,35.81 31.75,35.31 R9.1 | R21.2 v15.75,12.32 | v19.56,13.72 19.56,12.83 19.18,12.45 R6.1 | IC3.7 28.74,22.9 29.08,23.24 29.08,23.75 29.84,24.51 v30.61,24.51 | v14.73,22.1 IC3.28 | 48.9,36.58 48.64,36.83 48.64,37.59 48.26,37.97 46.48,37.97 44.82,39.64 IC2.P$15 | v9.78,28.19 10.29,27.69 13.86,27.69 R11.1 15.2,28.74 17.44,30.99 R5.1 | v37.22,20.4 35.74,21.88 34.49,21.88 34.49,21.89 32.69,23.7 32.69,24.44 32.7,24.45 R22.2 C18.2 32.83,26.23 v32.83,27.5 | v45.06,23.29 45.06,22.61 45.95,21.72 C16.2 | R23.2 55.12,23.8 54.66,24.26 v51.31,24.26 51.28,24.26 | C19.2 19.81,13.97 v19.56,13.72 | C17.2 50.93,26.77 50.72,26.97 50.19,26.97 50.04,27.13 PWR.+ | v51.87,29.69 53.87,29.69 J8.2
  Top 0.406: 5.84,23.37 v5.84,7.49 | 5.84,23.37 v7.37,23.37 | 5.84,23.37 5.84,29.72 v6.63,30.5
  Top 0.61: v52.58,18.29 IC4.4 | 51.28,24.26 50.93,24.61 C17.2
  Bottom 0.254: v33.53,38.23 34.16,37.59 34.16,29.59 32.83,28.26 v32.83,27.5 | v51.87,29.69 51.87,31.93 53.21,33.27 53.21,36.7 53.34,36.83 | 53.34,36.83 55.12,38.61 TP1.1 | v50.04,39.37 50.8,39.37 53.34,36.83 | v9.78,28.19 v9.78,28.21 9.54,28.45 7.37,28.45 6.6,29.21 6.6,30.48 v6.63,30.5
  Bottom 0.406: J5.11 J4.11 5.59,34.8 6.63,33.76 v6.63,30.5 | J8.2 55.12,27.94 54.23,27.05
  other vias: 48.72,14 55.5,9.4 49.66,9.4 55.12,17.27 50.04,17.27
  pour Bottom (isolate 0.305, rank 3): 0.25,28.45 0.25,0.25 56.64,0.25 56.64,29.72 52.58,29.72 52.58,25.91 39.88,25.91 33.53,31.5 7.24,31.5 7.24,28.45
  pour Top: 47.5,14.48 47.5,8.64 50.04,8.64 50.8,9.4 54.36,9.4 55.12,8.64 56.39,8.64 56.39,22.1 48.77,22.1 48.77,14.48
5V_SVO  (via drill 0.35, 0.38)
  Top 0.254: U5.4 10.03,42.59 v10.01,42.56 | R29.1 12.29,39.24 12.29,38.96
  Top 0.61: v5.97,36.07 5.97,33.91 J4.10 J5.10 | v10.03,38.96 12.29,38.96 14.05,40.72 U1.3 15.82,42.52 v16.57,43.28 16.57,44.39 C20.2
  Bottom 0.254: 10.03,43.16 10.03,42.59 v10.01,42.56
  Bottom 0.406: JP8.2 4.32,39.62
  Bottom 0.61: JP2.2 JP3.2 JP4.2 17.14,52.58 18.57,51.16 18.57,49.1 16.57,47.11 v16.57,43.28 | JP8.2 JP7.2 JP6.2 JP5.2 4.32,48.77 4.85,49.3 7.49,49.3 9.09,47.7 9.09,44.09 10.03,43.16 v10.03,38.96 | 4.32,39.62 5.97,37.97 v5.97,36.07
5V_SVO_RB1
  Top 0.254: C26.1 15.19,44.55 C27.1 | 10.57,45.95 10.56,45.96 | 10.56,46.98 10.54,46.99 | 8.05,51.36 9.27,52.58 JP1.2
  Top 0.305: U5.3 10.56,45.96 10.56,46.98 | 10.54,46.99 8.05,49.48 8.05,51.36 | C26.1 11.51,45.95 | 11.51,45.95 10.57,45.95 | U5.2 11.51,45.95
D+  (via drill 0.38)
  Top 0.254: IC3.43 25.3,14.71 v25.91,14.1 | J3.D+ 14.48,8.76 14.73,9.02 v14.73,10.57
  Bottom 0.254: v25.91,14.1 25.02,13.21 23.62,13.21 22.61,12.19 20.7,12.19 19.07,10.57 v14.73,10.57
D-  (via drill 0.38)
  Top 0.254: IC3.42 24.5,14.11 v24.51,14.1 | J3.D- 13.83,8.88 13.51,9.2 v13.51,10.57
  Bottom 0.254: v24.51,14.1 23.75,14.1 22.35,12.7 20.45,12.7 18.77,11.02 15.55,11.02 15.11,11.45 13.89,11.45 13.54,11.1 13.54,10.59 v13.51,10.57
DIR_1  (via drill 0.38)
  Top 0.254: IC3.5 29.3,21.3 29.3,21.25 v29.34,21.21 | IC1.P$19 29.07,41.65 29.59,42.16 32.84,42.16 v33.5,42.82 33.5,43.69 33.53,43.71 LED1.+
  Bottom 0.254: J4.6 4.45,22.1 6.73,19.81 16.13,19.81 17.91,21.59 18.67,21.59 19.05,21.21 v29.34,21.21 29.46,21.21 30.1,20.57 31.24,20.57 34.48,23.81 34.48,26.8 35.69,28 35.69,38.86 33.5,41.05 v33.5,42.82
DIR_2  (via drill 0.38)
  Top 0.254: IC3.3 25.79,19.7 v25.78,19.68 | IC2.P$19 45.59,41.65 46.1,42.16 48.9,42.16 v49.66,42.16 49.89,42.39 49.89,43.26 50.01,43.38 LED2.+
  Bottom 0.254: v49.66,42.16 49.66,40.51 47.37,38.23 47.37,31.24 42.32,26.19 42.32,26.16 42.13,25.97 39.24,25.97 39.05,25.78 36.45,25.78 35.62,24.96 35.62,23.43 31.75,19.56 25.91,19.56 v25.78,19.68 23.11,19.68 22.61,20.19 19.05,20.19 17.65,18.8 5.08,18.8 J4.5
ENABLE_1  (via drill 0.38)
  Top 0.254: v11.94,24.13 11.94,26.75 12.37,27.18 15.55,27.18 16.27,27.9 16.27,28.79 17.21,29.72 22.48,29.72 v23.37,30.61 22.99,30.99 R5.2 | IC1.P$2 21.02,42.15 v20.64,41.77
  Top 0.305: IC3.25 12.31,24.5 v11.94,24.13
  Bottom 0.254: J4.7 11.43,24.64 v11.94,24.13 | v23.37,30.61 22.73,30.61 20.7,32.64 20.7,34.29 20.07,34.93 18.87,34.93 18.19,35.61 18.19,39.98 18.16,40.01 18.16,41.02 18.91,41.77 v20.64,41.77
ENABLE_2  (via drill 0.38)
  Top 0.254: v18.29,20.7 18.29,18.16 18.9,17.55 IC3.35 18.9,14.58 R6.2 | IC2.P$2 36.31,42.15 v35.94,41.78
  Bottom 0.254: J5.5 3.05,20.83 4.95,20.83 6.48,19.3 16.89,19.3 v18.29,20.7 28.7,20.7 29.34,20.07 31.5,20.07 35.05,23.62 35.05,26.61 36.26,27.81 36.26,41.47 v35.94,41.78
GND  (via drill 0.38)
  Top 0.254: 24.88,41.65 24.89,41.65 v24.89,41.15 | 41.65,41.65 41.4,41.65 v41.4,41.15
  Top 0.305: 21.47,41.65 IC1.P$3 24.76,41.65 | 24.76,41.65 24.77,41.66 | v26.92,41.15 IC1.P$18 32,41.15 | 41.66,41.66 41.65,41.65 IC2.P$3 37.85,41.65 | IC2.P$29 IC2.P$18 48.26,41.15 | 24.76,41.65 24.88,41.65
  Top 0.813: 1.78,48.77 JP8.1 J5.12 J4.12 6.22,37.34 | 7.24,55.12 19.05,55.12
  Bottom 0.813: 1.78,50.04 JP8.1 J5.12 J4.12 | 6.86,55.12 19.56,55.12
  other vias: 20.7,46.36 22.1,43.69 28.57,43.69 30.61,43.69 30.99,49.28 20.7,47.75 22.22,46.36 26.92,42.16 24.89,42.16 24.89,40.13 26.92,40.13 28.45,33.53 30.99,33.53 33.27,33.53 23.75,33.53 41.4,42.16 43.43,42.16 43.43,40.13 41.4,40.13 37.85,46.23 38.61,43.69 46.23,43.69 47.5,49.53 47.5,48.13 37.21,48.9 37.21,50.16 39.75,33.78 44.51,31.05 50.04,33.53 42.74,31.05 22.1,33.53 46.86,46.74 42.42,42.16 43.43,41.15 42.42,40.13 42.42,41.15 25.91,41.15 25.91,42.16 25.91,40.13 50.04,48.26 51.31,41.91 7.11,35.66 10.87,32.21 47.41,28.41
  pour Top (isolate 0.305, rank 3): 0.25,56.64 0.25,0.25 56.64,0.25 56.64,56.64
  pour Bottom (isolate 0.305, rank 2): 0.25,28.45 0.25,56.64 56.64,56.64 56.64,29.72 52.58,29.72 52.58,28.45 51.31,27.18 33.97,27.18 33.97,28.89 33.59,28.89 33.53,31.5 7.24,31.5 7.24,28.45
M1_OUT1A
  Top 0.305: 26.41,49.9 IC1.P$24
  Top 0.406: 26.41,49.9 26.41,50.54 JP9.2 27.18,52.71 28.45,53.98 J1.2
M1_OUT1B
  Top 0.254: 31.24,42.67 31.22,42.65
  Top 0.305: 31.34,42.78 31.24,42.67 | 31.22,42.65 IC1.P$21
  Top 0.406: 31.34,42.78 32.51,43.94 32.51,51.31 | 32.51,51.31 JP9.1 | J1.1 32.26,53.85 32.51,53.59 32.51,51.31
M1_OUT2A
  Top 0.305: 25.41,49.9 IC1.P$26
  Top 0.406: 25.41,49.9 25.41,51.31 JP9.3 24.64,53.21 J1.3
M1_OUT2B
  Top 0.305: IC1.P$1 21.51,42.65 21.46,42.7
  Top 0.406: 21.46,42.7 19.56,44.6 19.56,48.77 JP9.4 22.1,53.09 J1.4
M2_OUT1A
  Top 0.305: 42.92,49.78 IC2.P$24
  Top 0.406: 42.92,51.31 42.92,49.78 | 42.92,51.31 JP10.2 | J2.2 42.8,53.85 42.92,53.73 42.92,51.31
M2_OUT1B
  Top 0.254: 47.75,42.67 47.73,42.65
  Top 0.305: 47.86,42.78 47.75,42.67 | 47.73,42.65 IC2.P$21
  Top 0.406: 47.86,42.78 48.77,43.69 48.77,50.01 47.77,51 46.53,51 JP10.1 46.23,53.47 J2.1
M2_OUT2A
  Top 0.305: 41.92,49.78 IC2.P$26
  Top 0.406: 41.92,49.78 41.92,50.54 JP10.3 39.5,52.96 J2.3
M2_OUT2B
  Top 0.305: IC2.P$1 37.11,42.65 36.98,42.78
  Top 0.406: 36.98,42.78 36.07,43.69 36.07,51.31 | 36.07,51.31 JP10.4 | 36.07,51.31 36.07,53.34 J2.4
MCLR  (via drill 0.38)
  Top 0.254: IC1.P$12 26.41,33.65 26.42,33.64 26.43,33.64 27.81,32.26 29.08,32.26 31.11,30.23 v31.11,29.59 32.64,29.59 33.4,30.35 40.39,30.35 42.92,32.89 IC2.P$12 | v19.18,18.41 20.32,19.56 20.32,23.75 v20.07,24 20.07,25.65 21.3,26.89 IC3.18 | v37.02,24.32 36.07,23.37 SW2.3 34.93,22.73 34.29,23.37 R22.1 | v51.87,28.32 52.71,28.32 J8.1
  Bottom 0.254: v51.87,28.32 51.87,26.59 51.69,26.42 44.07,26.42 42.61,24.96 39.75,24.96 39.56,24.77 37.47,24.77 v37.02,24.32 37.02,23.3 32.26,18.54 27.69,18.54 26.92,17.78 25.65,17.78 24.77,18.67 22.61,18.67 22.1,19.18 19.94,19.18 v19.18,18.41 | v31.11,29.59 30.1,28.57 30.1,26.8 26.67,23.37 20.7,23.37 v20.07,24
MS1  (via drill 0.38)
  Top 0.254: IC1.P$9 24.91,33.04 24.89,33.02 v24.89,32.13 | IC2.P$9 41.42,34.05 39.62,32.26 v32.77,32.26 | IC3.27 17.31,22.9 17.4,22.99 v17.78,22.99
  Bottom 0.254: v24.89,32.13 26.04,32.13 26.29,32.38 27.05,32.38 27.18,32.26 v32.77,32.26 32.8,32.26 33.66,31.41 33.66,29.84 31.11,27.3 31.11,26.29 27.18,22.35 19.43,22.35 19.18,22.61 18.16,22.61 v17.78,22.99
MS2  (via drill 0.38)
  Top 0.254: IC1.P$10 25.41,33.03 25.4,33.02 26.67,31.75 v26.67,31.5 | IC2.P$10 41.92,33.66 39.62,31.37 v31.5,31.37 | IC3.26 17.22,23.7 17.4,23.88 18.54,23.88 v18.92,23.49
  Bottom 0.254: v18.92,23.49 19.05,23.49 19.68,22.86 26.92,22.86 30.61,26.54 30.61,27.56 33.15,30.1 33.15,30.83 32.61,31.37 v31.5,31.37 31.11,31.75 26.92,31.75 v26.67,31.5
MS3  (via drill 0.38)
  Top 0.254: IC1.P$11 25.91,33.4 27.56,31.75 28.32,31.75 v29.59,30.48 | IC2.P$11 42.42,33.27 40.01,30.86 32.64,30.86 v32.26,30.48 | IC3.31 16.31,19.68 15.24,19.68 14.99,19.94 12.32,19.94 v11.05,21.21
  Bottom 0.254: v32.26,30.48 v29.59,30.48 29.59,27.05 26.42,23.88 21.46,23.88 20.45,24.89 19.86,24.89 19.35,24.38 18.68,24.38 18.18,23.88 17.4,23.88 16.89,23.37 16.89,22.1 15.62,20.83 11.43,20.83 v11.05,21.21
N$1
  Top 0.254: LED2.- R16.2
N$2
  Top 0.254: D2.- 45.26,16.09 45.24,16.11 | 47.6,16.46 48.01,16.46 F1.1
  Top 0.406: D3.- 45.24,16.11 | D2.- 46.65,16.09 47.02,16.46 47.6,16.46
N$3
  Top 0.254: C2.1 20.32,39.24 22.22,41.15 IC1.P$4
N$4
  Top 0.254: R13.2 R14.1 R18.1
N$5
  Top 0.254: IC1.P$5 22.49,40.65 21.21,39.37 21.21,35.56 20.95,35.31 20.41,35.31 C2.2
N$6
  Top 0.203: 40.49,12.86 J7.P$1
  Top 1.27: D1.+ 40.49,12.86
N$7
  Top 0.254: LED1.- R15.2
N$8
  Top 0.254: USB.- 29.54,2.92 R26.2
N$9
  Top 0.254: R27.1 R23.1 53.59,23.03 53.59,22.35 54.86,21.09 IC4.1
N$10
  Top 0.254: USR.- R25.2
N$11
  Top 0.254: PWR.- R20.2
N$16
  Top 0.254: IC2.P$4 38.61,41.15 36.07,38.61 C4.1
N$17
  Top 0.254: IC2.P$5 39,40.65 36.96,38.61 36.96,35.56 36.7,35.31 C4.2
N$19
  Top 0.254: IC1.P$13 26.91,37.86 27.81,36.96 28.41,36.96 28.41,36.87 R8.1
N$20
  Top 0.254: IC1.P$8 24.41,37.49 C10.1
N$21
  Top 0.254: IC1.P$6 22.75,40.15 22.1,39.5 C5.1
N$31
  Top 0.203: R3.2 24.78,48.3
  Top 0.254: 24.91,48.21 24.78,48.21 24.78,48.3
  Top 0.305: 24.91,48.21 IC1.P$27
N$32
  Top 0.203: R1.2 27.01,48.28 27.01,48.18
  Top 0.254: 26.91,48.08 26.91,48.18 27.01,48.18
  Top 0.305: 26.91,48.08 IC1.P$23
N$36
  Top 0.406: C15.2 48.39,20.56 48.4,20.55 48.44,20.55 | IC4.3 48.44,20.55 | 48.44,20.55 48.06,20.17 F1.2
N$41
  Top 0.254: IC2.P$6 39.26,40.15 38.35,39.24 C6.1
N$43
  Top 0.203: R2.2 44.01,48.67 43.52,48.18
  Top 0.254: 43.42,48.08 43.42,48.18 43.52,48.18
  Top 0.305: 43.42,48.08 IC2.P$23
N$44
  Top 0.203: R4.2 40.83,48.67 41.32,48.18
  Top 0.254: 41.42,48.08 41.42,48.18 41.32,48.18
  Top 0.305: 41.42,48.08 IC2.P$27
N$45
  Top 0.254: IC2.P$8 40.92,37.36 C9.1
N$48
  Top 0.254: IC2.P$13 43.42,37.61 44.07,36.96 44.92,36.96 44.92,36.87 R7.1
N$1234
  Top 0.254: C26.2 13.16,43.79 13.16,43.39 12.63,42.87 12.63,42.77 U5.6 12.32,42.45 12.32,41.1 R29.2
PRG_SW
  Top 0.254: SW1.2 13.84,17.23 14.92,17.23 15.75,16.41 | IC3.30 17.22,20.5 17.53,20.19 17.53,17.47 16.48,16.43 15.77,16.43 15.75,16.41 | 15.75,16.41 R21.1
RA1  (via drill 0.38)
  Top 0.254: v18.32,25.65 18.32,25.68 19.7,27.06 IC3.20
  Bottom 0.254: v18.32,25.65 18.17,25.65 5.97,25.65 4.45,27.18 J4.8
RA2  (via drill 0.38)
  Top 0.254: IC3.21 18.9,28.73 18.41,29.21 17.57,29.21 17.16,28.8 17.16,27.55 v16.72,27.11
  Bottom 0.254: v16.72,27.11 16.66,27.18 15.64,26.16 7.24,26.16 4.95,28.45 3.05,28.45 J5.8
RA3  (via drill 0.38)
  Top 0.254: IC3.22 18.1,26.93 v17.71,26.54 | J4.9 4.34,29.73 4.33,29.73 9.25,34.65 9.25,39.52 9.65,39.93 10.39,39.93 10.64,40.18 R28.1 10.64,41.38 10.97,41.71 11.23,41.71 11.51,41.99 U5.5
  Bottom 0.254: v17.71,26.54 17.93,26.76 17.93,27.82 17.17,28.58 16.64,28.58 14.73,26.67 7.49,26.67 4.45,29.72 J4.9
RA5  (via drill 0.38)
  Top 0.254: IC3.24 17.28,25.3 v17.84,24.74
  Bottom 0.254: v17.84,24.74 17.43,25.15 5.71,25.15 4.95,25.91 3.05,25.91 J5.7
RB0  (via drill 0.38)
  Top 0.254: IC3.8 23.98,23.7 v22.99,24.69
  Bottom 0.254: JP2.3 11.56,49.66 11.56,36.58 15.37,32.77 18.29,32.77 22.73,28.32 24.94,28.32 26.29,26.97 26.29,25.15 25.53,24.38 23.29,24.38 v22.99,24.69
RB1  (via drill 0.51)
  Top 0.254: IC3.9 25.16,24.5 TP6.P$1
  Bottom 0.254: TP6.P$1 25.4,25.4 25.78,25.78 25.78,26.8 24.77,27.81 22.48,27.81 18.03,32.26 15.11,32.26 11.05,36.32 11.05,48.51 9.52,50.04 JP1.3
  other vias: 24.26,25.4
RB2  (via drill 0.38)
  Top 0.254: IC3.10 26.77,25.3 26.54,25.53 26.54,26.54 27.18,27.18 v27.18,27.43
  Bottom 0.254: v27.18,27.43 26.54,27.43 25.15,28.83 22.99,28.83 18.54,33.27 15.62,33.27 12.07,36.83 12.07,47.62 JP3.3
RB3  (via drill 0.38)
  Top 0.254: IC3.11 27.9,26.75 v28.57,27.43
  Bottom 0.254: v28.57,27.43 27.69,28.32 26.42,28.32 25.4,29.34 23.24,29.34 18.8,33.78 15.88,33.78 12.57,37.08 12.57,47.24 13.97,48.64 15.62,48.64 JP4.3
RB4  (via drill 0.38)
  Top 0.254: IC3.14 24.5,26.96 v24.99,26.47
  Bottom 0.254: JP5.3 6.86,46.99 8.43,45.41 8.43,43.71 9.27,42.88 9.27,37.34 14.86,31.75 17.78,31.75 22.22,27.3 24.15,27.3 v24.99,26.47
RB5  (via drill 0.38)
  Top 0.254: IC3.15 23.7,26.67 v23.49,26.47
  Bottom 0.254: JP6.3 6.86,44.45 8.76,42.55 8.76,37.08 14.61,31.24 17.53,31.24 21.97,26.8 23.16,26.8 v23.49,26.47
RB6  (via drill 0.38)
  Top 0.254: v24.38,17.78 21.46,20.7 21.46,24.38 22.35,25.27 v22.35,25.91 22.35,26.42 22.9,26.96 IC3.16
  Bottom 0.254: v24.38,17.78 24.89,17.27 27.18,17.27 27.94,18.03 32.51,18.03 38.73,24.26 39.81,24.26 40.01,24.45 42.86,24.45 44.2,25.78 52.07,25.78 52.58,26.29 52.58,27.18 53.34,27.94 53.34,32.64 53.72,33.02 53.72,34.67 J8.5 | v22.35,25.91 22.1,25.91 17.27,30.73 14.35,30.73 8.25,36.83 8.25,40.51 6.86,41.91 JP7.3
RB7  (via drill 0.38)
  Top 0.254: v23.11,17.78 20.95,19.94 20.95,25.27 v21.21,25.53 21.21,26.04 22.1,26.92 IC3.17
  Bottom 0.254: v23.11,17.78 24.13,16.76 27.43,16.76 28.19,17.53 32.77,17.53 38.99,23.75 40.07,23.75 40.26,23.94 43.12,23.94 44.32,25.15 52.2,25.15 53.09,26.04 53.09,26.92 53.85,27.69 53.85,32.26 J8.4 | v21.21,25.53 21.21,26.04 17.02,30.23 14.1,30.23 6.86,37.47 JP8.3
RC0  (via drill 0.38)
  Top 0.254: IC3.32 15.14,18.9 14.61,19.43 13.08,19.43 10.16,16.51 v9.65,16.51
  Bottom 0.254: v9.65,16.51 8.76,17.4 4.7,17.4 J4.4
RC2  (via drill 0.38)
  Top 0.254: IC3.36 19.7,17.67 v20.32,18.29 | v30.99,16.64 R14.2
  Bottom 0.254: J5.3 3.05,15.75 5.08,15.75 5.59,16.26 8.38,16.26 9.14,15.49 10.29,15.49 11.56,16.76 18.8,16.76 v20.32,18.29 20.7,18.67 21.72,18.67 22.22,18.16 22.22,17.02 22.99,16.26 27.69,16.26 28.19,16.76 30.86,16.76 v30.99,16.64
RC6  (via drill 0.38)
  Top 0.254: v26.92,14.73 26.67,14.73 26.1,15.3 IC3.44
  Bottom 0.254: v26.92,14.73 26.67,14.99 23.62,14.99 22.61,13.97 21.59,13.97 20.83,14.73 14.86,14.73 12.45,12.32 11.05,12.32 9.4,10.67 3.05,10.67 J5.1
RC7  (via drill 0.38)
  Top 0.254: v28.57,15.88 28.57,18.03 27.83,18.03 IC3.1 | 13.17,14.1 10.71,14.1 10.67,14.06 R12.2 | v13.08,15.37 13.08,14.18 13.17,14.1 | 13.17,14.1 13.17,14.01 R17.1
  Bottom 0.254: v28.57,15.88 28.45,15.75 13.46,15.75 v13.08,15.37 12.45,15.37 10.29,13.21 3.05,13.21 J5.2
RD0  (via drill 0.38)
  Top 0.254: IC3.38 21.3,17.74 v21.34,17.78
  Bottom 0.254: v21.34,17.78 19.81,16.26 11.81,16.26 10.54,14.99 8.89,14.99 8.13,15.75 5.97,15.75 4.7,14.48 J4.3
RD1  (via drill 0.38)
  Top 0.254: v22.1,14.86 IC3.39
  Bottom 0.254: v22.1,14.86 21.72,15.24 14.61,15.24 12.19,12.83 10.8,12.83 9.91,11.94 J4.2
REF_RA0  (via drill 0.38)
  Top 0.254: IC1.P$17 29.46,40.65 v30.35,39.75 | v47.37,39.5 46.99,39.5 45.85,40.64 IC2.P$17 | v19.25,25.35 19.25,25.72 20.5,26.97 IC3.19 20.5,28.88 20.83,29.21 23.49,29.21 v24.51,30.23 | v27.81,30.86 29.08,29.59 29.84,29.59 30.73,28.7 31.5,28.7 31.88,29.08 33.02,29.08 33.78,29.84 34.8,29.84 | 34.8,29.84 v42.42,29.84 | 34.8,29.84 v34.8,28.32 | TP3.1 10.44,30.99 10.44,30.98 R11.2
  Bottom 0.254: v30.35,39.75 34.04,39.75 35.18,38.61 35.18,28.7 v34.8,28.32 | v42.42,29.84 45.21,29.84 46.86,31.5 46.86,38.99 v47.37,39.5 | v19.25,25.35 19.25,27.23 17.4,29.08 16.38,29.08 14.48,27.18 11.79,27.18 | 11.79,27.18 7.75,27.18 5.97,28.96 5.97,29.97 4.95,30.99 3.05,30.99 J5.9 | v24.51,30.23 27.18,30.23 v27.81,30.86 | TP3.1 10.43,30.99 11.81,29.61 11.81,27.2 11.79,27.18
SLEEP_1
  Top 0.254: IC1.P$14 27.41,38.12 27.56,37.97 29.08,37.97 30.1,36.96 30.99,36.96 R9.2
SLEEP_2
  Top 0.254: IC2.P$14 44.7,37.97 45.59,37.97 46.61,36.96 47.5,36.96 R10.2
STEP_1  (via drill 0.38)
  Top 0.254: v30.99,21.46 29.84,20.32 28.96,20.32 28.78,20.5 IC3.4 | IC1.P$16 29.07,40.15 29.34,39.88 29.34,39.37 29.97,38.73 v31.24,38.73
  Bottom 0.254: v31.24,38.73 32.77,38.73 33.15,39.12 33.91,39.12 34.67,38.35 34.67,29.34 33.91,28.57 33.91,24 31.37,21.46 v30.99,21.46 30.86,21.46 30.23,22.1 27.69,22.1 27.3,21.72 19.3,21.72 18.92,22.1 17.65,22.1 15.88,20.32 8,20.32 4.95,23.37 3.05,23.37 J5.6
STEP_2  (via drill 0.38)
  Top 0.254: v49.02,38.61 47.12,38.61 45.58,40.15 IC2.P$16 | IC3.2 26.64,18.9 v26.42,18.67
  Bottom 0.254: v49.02,38.61 47.88,37.47 47.88,30.99 42.57,25.68 42.57,25.65 42.38,25.46 39.5,25.46 39.31,25.27 36.7,25.27 36.13,24.7 36.13,23.18 32,19.05 26.8,19.05 v26.42,18.67 25.53,18.67 25.02,19.18 22.86,19.18 22.35,19.68 19.3,19.68 17.91,18.29 3.05,18.29 J5.4
USB_LED  (via drill 0.38)
  Top 0.254: IC3.41 23.7,13.39 25.4,11.68 v25.91,11.68 | v32.38,3.94 31.81,4.51 31.08,4.51 31.01,4.45 USB.+
  Bottom 0.254: v25.91,11.68 30.86,11.68 32.26,10.29 32.26,3.94 v32.38,3.94
USR_LED  (via drill 0.38)
  Top 0.254: IC3.40 22.9,13.42 v25.91,10.41 | v22.1,3.05 22.1,4.01 22.5,4.42 23.36,4.42 23.36,4.36 USR.+
  Bottom 0.254: v25.91,10.41 25.91,6.86 v22.1,3.05
V+  (via drill 0.38, 0.51)
  Top 0.254: v38.35,33.72 C6.2 | 24.41,44.96 C7.1 | 27.41,44.96 C8.1 | C5.2 22.1,35.18 20.83,33.91 v19.81,33.91 | v40.07,26.92 40.07,26.91 | D2.+ 45.8,19.4 | R13.1 32.73,15.33 33.49,15.33 35.38,17.22 37.77,17.22 39.35,18.8 39.62,18.8 40.49,19.66 D1.-
  Top 0.305: IC1.P$28 24.41,44.96 24.41,45.7 v23.88,46.23 | IC1.P$22 27.41,44.96 27.41,45.7 v27.94,46.23 | 40.92,44.96 40.92,45.7 v40.39,46.23 | 40.92,44.96 IC2.P$28 | 40.92,44.96 C11.1 | 43.92,44.96 43.92,45.57 v44.58,46.23 | 43.92,44.96 IC2.P$22 | 43.92,44.96 C12.1 | U1.1 18.62,43.48 18.47,43.64 18.24,43.64 18.03,43.84 C21.2
  Top 0.406: v30.61,47.5 30.1,47.5 28.83,46.23 v27.94,46.23 | v40.39,46.23 39.5,46.23 38.23,47.5 v37.59,47.5 | 40.49,22.82 43.63,22.82 45.8,20.65 45.8,19.4
  Top 0.61: v17.42,42.11 18.62,42.11 U1.1
  Top 0.813: v40.07,26.92 40.07,28.4 C14.+ | D1.- 40.49,22.82 40.49,26.49 40.07,26.91
  Bottom 0.254: v19.81,33.91 19.43,33.91 19.05,34.29 18.24,34.29 17.42,35.1 v17.42,42.11
  Bottom 0.406: v27.94,46.23 v23.88,46.23 | v40.39,46.23 v44.58,46.23
  Bottom 0.61: v37.59,47.5 34.54,47.5 v30.61,47.5 28.32,49.78 20.65,49.78 17.42,46.56 v17.42,42.11
  Bottom 0.813: 38.23,33.53 38.23,42.42 34.54,46.1 34.54,47.5 | 38.23,33.53 38.23,28.77 v40.07,26.92 | v38.35,33.72 38.35,33.66 38.23,33.53
VBUS  (via drill 0.35, 0.38)
  Top 0.254: R12.1 10.67,10.45 v12.99,8.14 13.18,7.95 J3.VBUS | 43.61,19.4 D3.+
  Top 0.406: v43.61,21.08 43.61,19.4
  Bottom 0.406: v43.61,21.08 35.1,12.57 24,12.57 19.57,8.14 v12.99,8.14
VCAP
  Top 0.305: IC3.23 14.44,26.1 14.25,25.91 C13.2

### Text on the board
Top: schmalzhaus.com/EBB | EiBot | Board
Bottom: 1/19/2021
tPlace: GND | GND | 5V | 5V | B1 | B0 | B2 | B3 | GND | B4 | MOTOR1 | DIR1 | MOTOR2 | DIR2 | B5 | 3.3V | B6 | B7 | GND | 3.3V | TP3 | 5V | schmalzhaus.com/EBB | A0 | A3 | CURRENT | 3.3V | A2 | A1 | ADJ | ICSP | A5 | E0 | D6 | D7 | C1 | D5 | D4 | C0 | PRG | RST | C2 | D0 | C7 | D1 | C6 | GND | 9-25VDC | J5 | J4 | EBB | v2.7 | EiBot | Board | PWR | IN | GND | USR | USB
bPlace: GND | 5V | GND | 5V | B1 | B0 | B2 | B3 | B5 | B4 | GND | Arm | Pen | MOTOR 1 | MOTOR 2 | B6 | Servos | 3.3V | B7 | GND | GND | 3.3V | 3.3V | EiBotBoard | PGC(RB6) | 5V | 5V | PGD(RB7) | A0 | A3 | Released under Creative | ICSP | GND | Commons V3.0 Attribution | A2 | A1 | Licence by SchmalzHaus | 3.3V | A5 | E0 | MCLR | D6 | D7 | C1 | D5 | D4 | C0 | C2 | D0 | C7 | D1 | C6 | GND | IO PINS | J5 | J4 | for more information see: | www.schmalzhaus.com/EBB
Document: ASSEMBLY NOTES: UNLESS OTHERWISE SPECIFIED / 1. ALL COMONENTS ARE RoHS COMPLIANT / 2. ALL COMPONENTS MOUNTED ON THE TOP SIDE / 3. ALL COMPONENTS SHALL BE MOUNTED FLUSH TO THE BOARD / 4. ALL UNUSED COMPONENTS PADS SHALL BE FREE OF SOLDER / 8. UNPOPULATED COMPONENTS: SEE BILL OF MATERIALS / 9. FINISHED BOARD SHALL BE FREE OF ALL RESIDUES | Notes: / This PCB to be manufactued to meet all acceptance levels / of a CLASS 2 PCB per ANSI/IPC-A-600G. / Material: Isola PCL370HR FR-4 or equivalent. / 2 Layers / Cu weight external layers : 1oz / Finished overall thickenss : 0.062 / Finish: / Soldermask over bare copper (SMOBC) with / Hot-Air-Leveled-Solder / All Board materials must be Lead Free, RoHS Compliant / Soldermask: Dynachem EPIC 200 LPI or equivalent. / Soldermask Color: White / Silkscreen Color: Black / Board outline and slots included in profile.gbr file / / All holes to be located by the NC Drill File. / Indicate Country where PCB was fabricated on the / side indicated. / Any deviation from the above specs must be approved / by either / Windell Oskay, windell@evilmadscientist.com, (408) 462-1064 / or / Brian Schmalz, brian@schmalzhaus.com, (612) 237-5628 | TITLE: EiBotBoard (EBB) / VERSION: 2.7 / DATE: 01/20/2021 / PCB DESIGNER: BRIAN SCHMALZ / ENGINEER: BRIAN SCHMALZ | Copyright 2021 Brian Schmalz Copyright and related rights are licensed under the Solderpad Hardware License, Version 2.1 (the "License"); / you may not use this file except in compliance with the License. You may obtain a copy of the License at http://http://solderpad.org/licenses/SHL-2.1/. / Unless required by applicable law or agreed to in writing, software, hardware and materials distributed under this License is distributed on an / "AS IS" BASIS, WITHOUT WARRANTIES OR CONDITIONS OF ANY KIND, either express or implied. See the License for the specific language / governing permissions and limitations under the License.
DrillLegend: LAYER-STACK
DrillLegend_01-16: 01-16
DrillLegend_01-20: 01-20
Contour: Notes: / This PCB to be manufactued to meet all acceptance levels / of a CLASS 2 PCB per ANSI/IPC-A-600G. / Material: Isola PCL370HR FR-4 or equivalent. / Multilayer / 2 Layers / Controlled Impedance / Cu weight external layers : 1oz / Cu weight internal layers : / Finished overall thickenss : 0.062 / Finish: / Immersion Gold / X Immersion Tin / Soldermask over bare copper (SMOBC) with / Hot-Air-Leveled-Solder / If edge connector fingers are present, plate / with Nicel/Gold >= 20 microinches Gold / / Soldermask: Dynachem EPIC 200 LPI or equivalent. / Soldermask Color: Green / Silkscreen Color: White / / Artwork Set No. 05-10133 Rev 1.5 / / All holes to be located by the NC Drill File. / Indicate Country where PCB was fabricated on the / side indicated. / Any devication from the above specs must be approved / by Schmalz Haus LLC. | Notes: / This PCB to be manufactued to meet all acceptance levels / of a CLASS 2 PCB per ANSI/IPC-A-600G. / Material: Isola PCL370HR FR-4 or equivalent. / Multilayer / 2 Layers / Controlled Impedance / Cu weight external layers : 1oz / Cu weight internal layers : / Finished overall thickenss : 0.062 / Finish: / Immersion Gold / X Immersion Tin / Soldermask over bare copper (SMOBC) with / Hot-Air-Leveled-Solder / If edge connector fingers are present, plate / with Nicel/Gold >= 20 microinches Gold / / Soldermask: Dynachem EPIC 200 LPI or equivalent. / Soldermask Color: Green / Silkscreen Color: White / / Artwork Set No. 05-10133 Rev 1.5 / / All holes to be located by the NC Drill File. / Indicate Country where PCB was fabricated on the / side indicated. / Any devication from the above specs must be approved / by Schmalz Haus LLC.